# Altium schematic sheet Peripherals.SchDoc
size A4
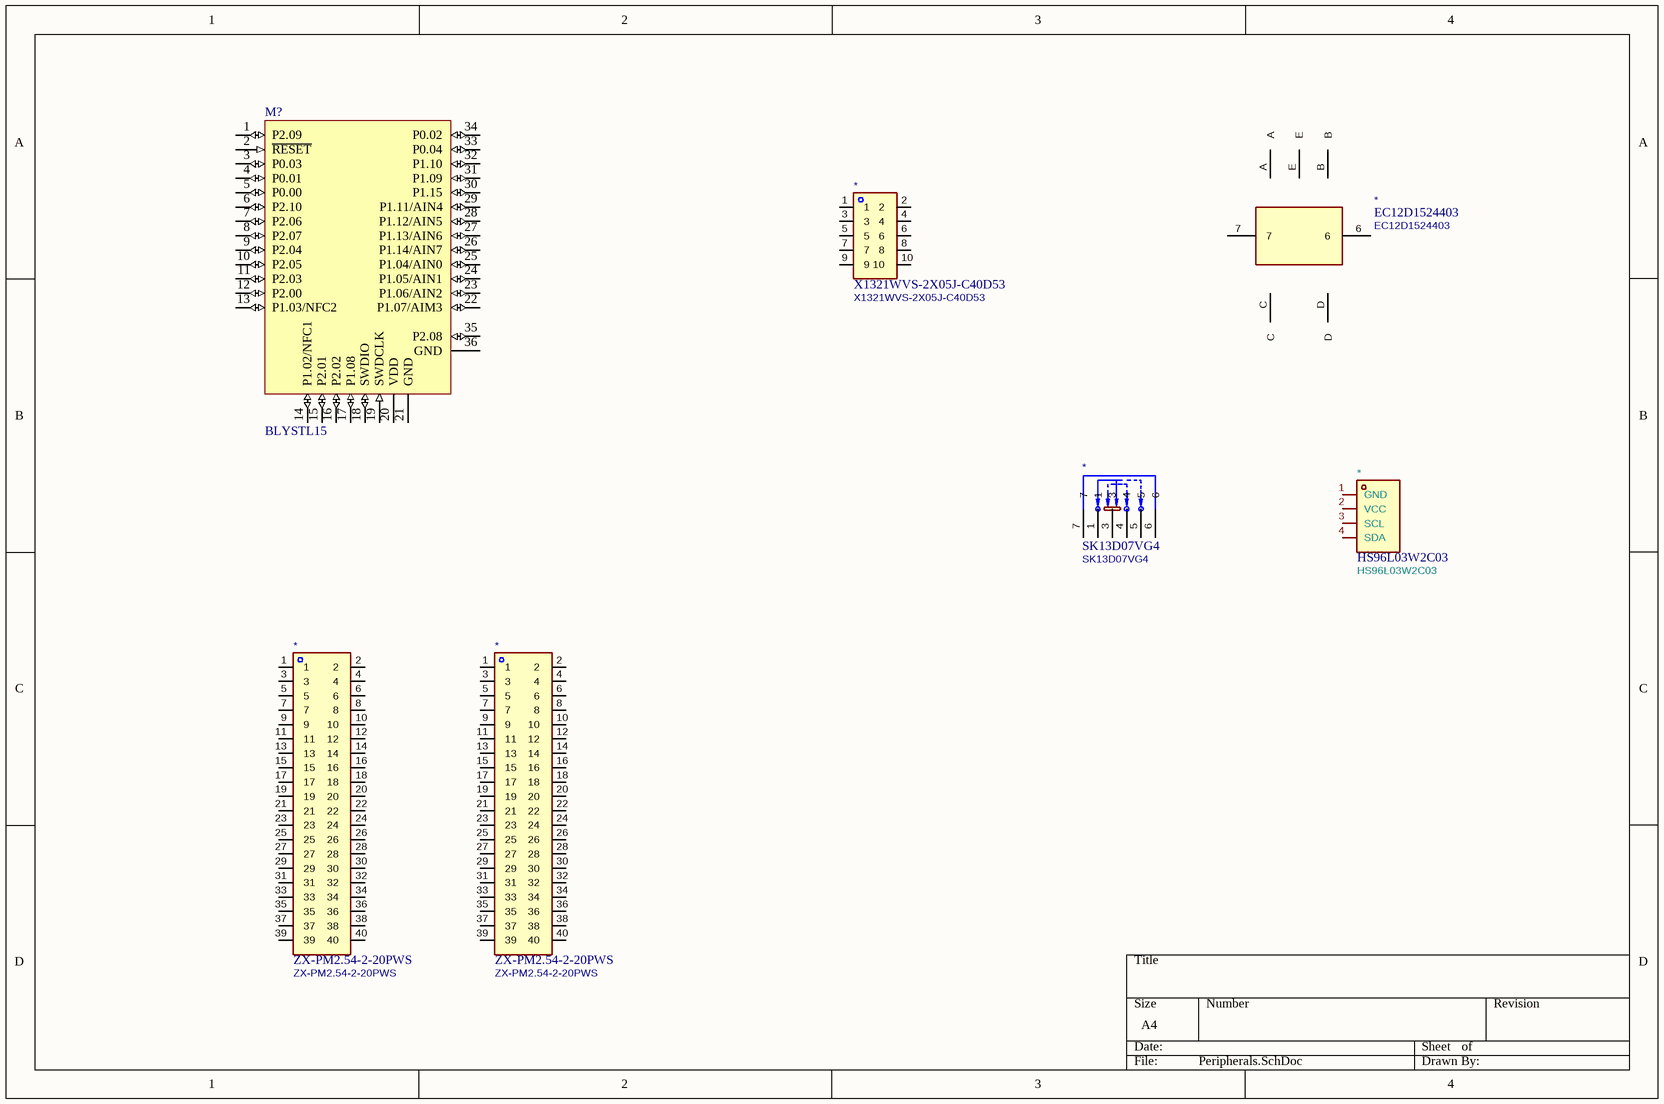
[diagram p0: Peripherals.SchDoc]

## Parts
(Parts that share a designator on the sheet are numbered #1, #2 ... from top to bottom, then left to right.)
*#1  X1321WVS-2X05J-C40D53  [HDR-SMD_10P-P1.27-V-M-C2-C5-LS5.3]
*#2  EC12D1524403  [SW-TH_EC12D1524403]
*#3  SK13D07VG4  [SW-TH_SK13D07VG4]
*#4  HS96L03W2C03  [OLED-TH_L27.8-W27.2-P2.54_C9900033791]
*#5  ZX-PM2.54-2-20PWS  [HDR-TH_40P-P2.54-H-F-R2-C20-S2.54-W8.5_1]
*#6  ZX-PM2.54-2-20PWS  [HDR-TH_40P-P2.54-H-F-R2-C20-S2.54-W8.5_1]
M?  BLYSTL15  [BLYSTL15]

## Nets

Not connected (* = marked no-connect by the designer): *#1 1 2 3 4 5 6 7 8 9 10; *#2 6 7 A B C D E; *#3 1 3 4 5 6 7; *#4 1(GND) 2(VCC) 3(SCL) 4(SDA); *#5 1 2 3 4 5 6 7 8 9 10 11 12 13 14 15 16 17 18 19 20 21 22 23 24 25 26 27 28 29 30 31 32 33 34 35 36 37 38 39 40; *#6 1 2 3 4 5 6 7 8 9 10 11 12 13 14 15 16 17 18 19 20 21 22 23 24 25 26 27 28 29 30 31 32 33 34 35 36 37 38 39 40; M? 1(P2.09) 2(~{RESET}) 3(P0.03) 4(P0.01) 5(P0.00) 6(P2.10) 7(P2.06) 8(P2.07) 9(P2.04) 10(P2.05) 11(P2.03) 12(P2.00) 13(P1.03/NFC2) 14(P1.02/NFC1) 15(P2.01) 16(P2.02) 17(P1.08) 18(SWDIO) 19(SWDCLK) 20(VDD) 21(GND) 22(P1.07/AIM3) 23(P1.06/AIN2) 24(P1.05/AIN1) 25(P1.04/AIN0) 26(P1.14/AIN7) 27(P1.13/AIN6) 28(P1.12/AIN5) 29(P1.11/AIN4) 30(P1.15) 31(P1.09) 32(P1.10) 33(P0.04) 34(P0.02) 35(P2.08) 36(GND)

## Library data of the parts
*#1 = X1321WVS-2X05J-C40D53: Manufacturer: XKB Connection(中国星坤); ki_keywords: Pin Headers; Footprint: easyeda2kicad:HDR-SMD_10P-P1.27-V-M-C2-C5-LS5.3; Supplier: https://www.lcsc.com/datasheet/C2881910.pdf; MPN: X1321WVS-2x05J-C40D53; LCSC Part: C2881910; Value: X1321WVS-2X05J-C40D53
*#2 = EC12D1524403: Manufacturer: ALPSALPINE(阿尔卑斯阿尔派); ki_keywords: Rotary Encoders; Footprint: easyeda2kicad:SW-TH_EC12D1524403; Supplier: https://lcsc.com/product-detail/Coded-Rotary-Switches_ALPS_EC12D1524403_EC12D1524403_C112349.html; MPN: EC12D1524403; LCSC Part: C112349; Value: EC12D1524403
*#3 = SK13D07VG4: Manufacturer: SHOU HAN(首韩); ki_keywords: Slide Switches; Footprint: easyeda2kicad:SW-TH_SK13D07VG4; Supplier: https://www.lcsc.com/datasheet/C2681581.pdf; MPN: SK13D07VG4; LCSC Part: C2681581; Value: SK13D07VG4
*#4 = HS96L03W2C03: Manufacturer: HS(汉昇); ki_keywords: OLED Displays Modules; Footprint: easyeda2kicad:OLED-TH_L27.8-W27.2-P2.54_C9900033791; Supplier: https://www.lcsc.com/datasheet/C5248080.pdf; MPN: HS96L03W2C03; LCSC Part: C5248080; Value: HS96L03W2C03
*#5 *#6 = ZX-PM2.54-2-20PWS: Manufacturer: Megastar(兆星); Footprint: easyeda2kicad:HDR-TH_40P-P2.54-H-F-R2-C20-S2.54-W8.5_1; Supplier: https://www.lcsc.com/datasheet/C49326201.pdf; MPN: ZX-PM2.54-2-20PWS; LCSC Part: C49326201; Value: ZX-PM2.54-2-20PWS
M? = BLYSTL15: Nordic  nRF54L15 - BLE module